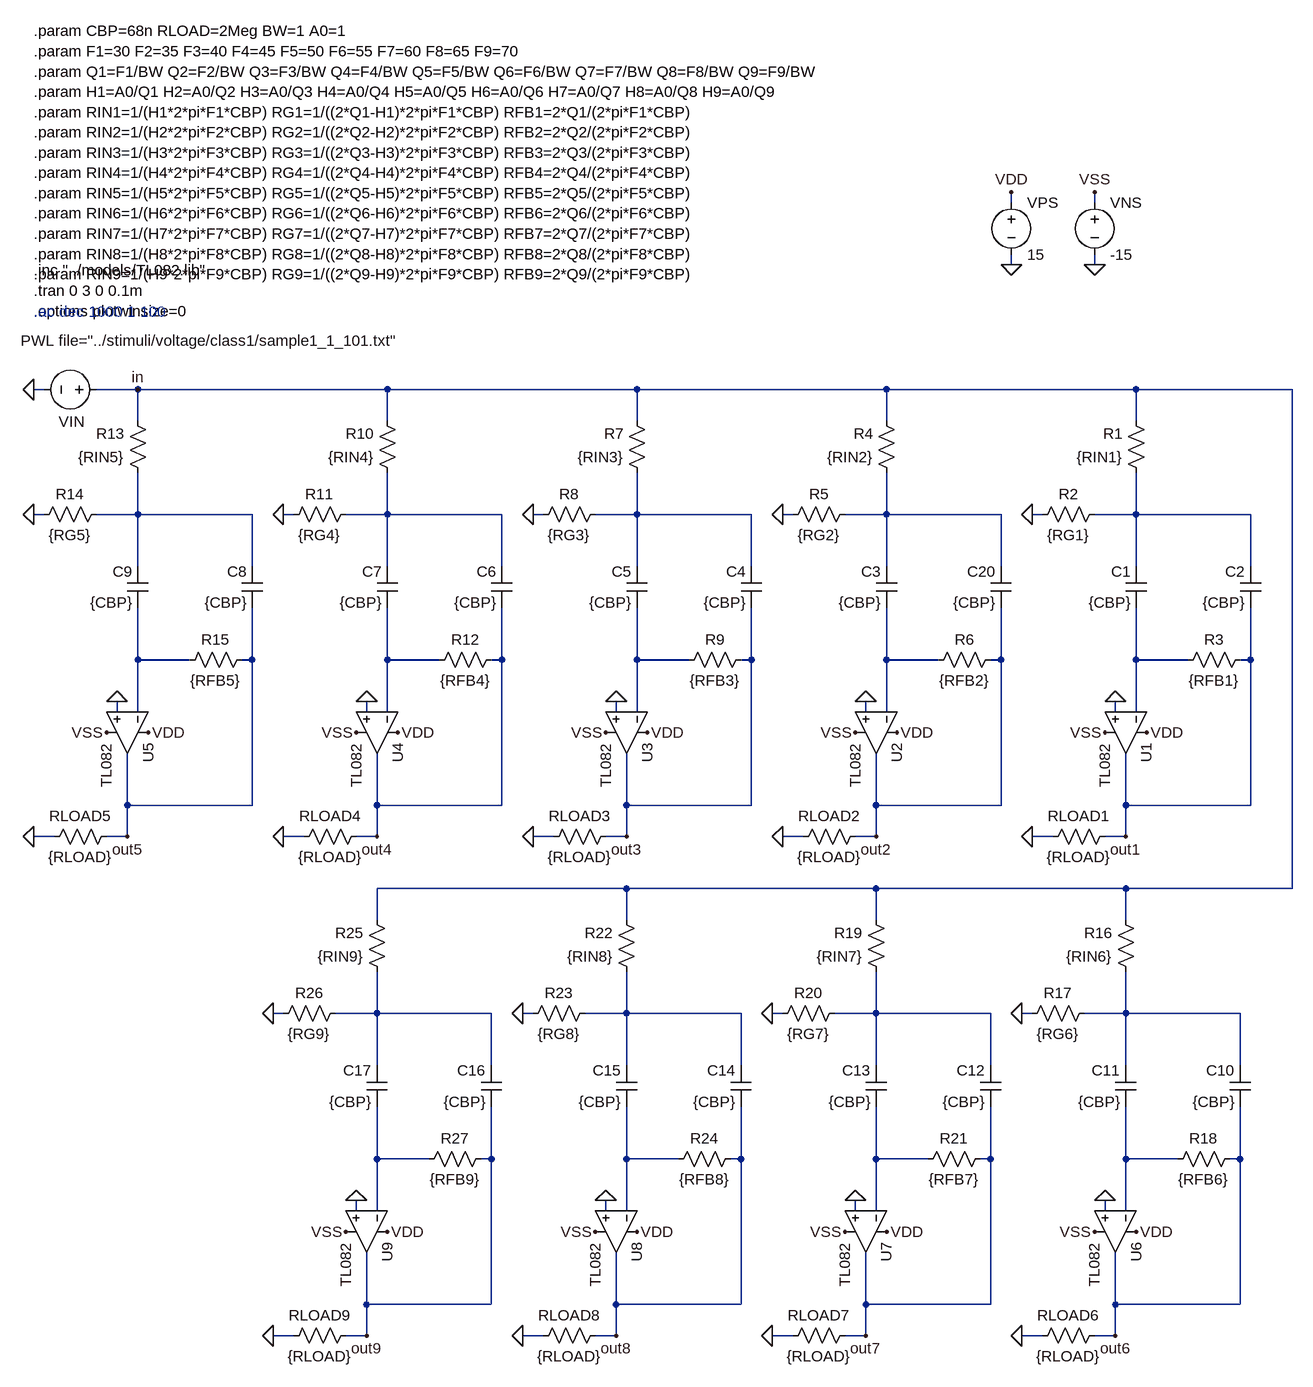
[diagram p0: schematic bpf9.asc]
bpf9.asc, the LTspice schematic file:
Version 4.1
SHEET 1 3572 2112
WIRE 880 -256 880 -272
WIRE 1008 -256 1008 -272
WIRE 880 -160 880 -176
WIRE 1008 -160 1008 -176
WIRE -608 32 -624 32
WIRE -464 32 -528 32
WIRE -80 32 -464 32
WIRE 304 32 -80 32
WIRE 688 32 304 32
WIRE 1072 32 688 32
WIRE 1312 32 1072 32
WIRE -464 80 -464 32
WIRE -80 80 -80 32
WIRE 304 80 304 32
WIRE 688 80 688 32
WIRE 1072 80 1072 32
WIRE -608 224 -624 224
WIRE -464 224 -464 160
WIRE -464 224 -528 224
WIRE -288 224 -464 224
WIRE -224 224 -240 224
WIRE -80 224 -80 160
WIRE -80 224 -144 224
WIRE 96 224 -80 224
WIRE 160 224 144 224
WIRE 304 224 304 160
WIRE 304 224 240 224
WIRE 480 224 304 224
WIRE 544 224 528 224
WIRE 688 224 688 160
WIRE 688 224 624 224
WIRE 864 224 688 224
WIRE 928 224 912 224
WIRE 1072 224 1072 160
WIRE 1072 224 1008 224
WIRE 1248 224 1072 224
WIRE -464 304 -464 224
WIRE -288 304 -288 224
WIRE -80 304 -80 224
WIRE 96 304 96 224
WIRE 304 304 304 224
WIRE 480 304 480 224
WIRE 688 304 688 224
WIRE 864 304 864 224
WIRE 1072 304 1072 224
WIRE 1248 304 1248 224
WIRE -464 448 -464 368
WIRE -384 448 -464 448
WIRE -288 448 -288 368
WIRE -288 448 -304 448
WIRE -80 448 -80 368
WIRE 0 448 -80 448
WIRE 96 448 96 368
WIRE 96 448 80 448
WIRE 304 448 304 368
WIRE 384 448 304 448
WIRE 480 448 480 368
WIRE 480 448 464 448
WIRE 688 448 688 368
WIRE 768 448 688 448
WIRE 864 448 864 368
WIRE 864 448 848 448
WIRE 1072 448 1072 368
WIRE 1152 448 1072 448
WIRE 1248 448 1248 368
WIRE 1248 448 1232 448
WIRE -496 528 -496 512
WIRE -464 528 -464 448
WIRE -112 528 -112 512
WIRE -80 528 -80 448
WIRE 272 528 272 512
WIRE 304 528 304 448
WIRE 656 528 656 512
WIRE 688 528 688 448
WIRE 1040 528 1040 512
WIRE 1072 528 1072 448
WIRE -480 672 -480 592
WIRE -288 672 -288 448
WIRE -288 672 -480 672
WIRE -96 672 -96 592
WIRE 96 672 96 448
WIRE 96 672 -96 672
WIRE 288 672 288 592
WIRE 480 672 480 448
WIRE 480 672 288 672
WIRE 672 672 672 592
WIRE 864 672 864 448
WIRE 864 672 672 672
WIRE 1056 672 1056 592
WIRE 1248 672 1248 448
WIRE 1248 672 1056 672
WIRE -592 720 -624 720
WIRE -480 720 -480 672
WIRE -480 720 -512 720
WIRE -208 720 -240 720
WIRE -96 720 -96 672
WIRE -96 720 -128 720
WIRE 176 720 144 720
WIRE 288 720 288 672
WIRE 288 720 256 720
WIRE 560 720 528 720
WIRE 672 720 672 672
WIRE 672 720 640 720
WIRE 944 720 912 720
WIRE 1056 720 1056 672
WIRE 1056 720 1024 720
WIRE 288 800 -96 800
WIRE 672 800 288 800
WIRE 1056 800 672 800
WIRE 1312 800 1312 32
WIRE 1312 800 1056 800
WIRE -96 848 -96 800
WIRE 288 848 288 800
WIRE 672 848 672 800
WIRE 1056 848 1056 800
WIRE -240 992 -256 992
WIRE -96 992 -96 928
WIRE -96 992 -160 992
WIRE 80 992 -96 992
WIRE 144 992 128 992
WIRE 288 992 288 928
WIRE 288 992 224 992
WIRE 464 992 288 992
WIRE 528 992 512 992
WIRE 672 992 672 928
WIRE 672 992 608 992
WIRE 848 992 672 992
WIRE 912 992 896 992
WIRE 1056 992 1056 928
WIRE 1056 992 992 992
WIRE 1232 992 1056 992
WIRE -96 1072 -96 992
WIRE 80 1072 80 992
WIRE 288 1072 288 992
WIRE 464 1072 464 992
WIRE 672 1072 672 992
WIRE 848 1072 848 992
WIRE 1056 1072 1056 992
WIRE 1232 1072 1232 992
WIRE -96 1216 -96 1136
WIRE -16 1216 -96 1216
WIRE 80 1216 80 1136
WIRE 80 1216 64 1216
WIRE 288 1216 288 1136
WIRE 368 1216 288 1216
WIRE 464 1216 464 1136
WIRE 464 1216 448 1216
WIRE 672 1216 672 1136
WIRE 752 1216 672 1216
WIRE 848 1216 848 1136
WIRE 848 1216 832 1216
WIRE 1056 1216 1056 1136
WIRE 1136 1216 1056 1216
WIRE 1232 1216 1232 1136
WIRE 1232 1216 1216 1216
WIRE -128 1296 -128 1280
WIRE -96 1296 -96 1216
WIRE 256 1296 256 1280
WIRE 288 1296 288 1216
WIRE 640 1296 640 1280
WIRE 672 1296 672 1216
WIRE 1024 1296 1024 1280
WIRE 1056 1296 1056 1216
WIRE -112 1440 -112 1360
WIRE 80 1440 80 1216
WIRE 80 1440 -112 1440
WIRE 272 1440 272 1360
WIRE 464 1440 464 1216
WIRE 464 1440 272 1440
WIRE 656 1440 656 1360
WIRE 848 1440 848 1216
WIRE 848 1440 656 1440
WIRE 1040 1440 1040 1360
WIRE 1232 1440 1232 1216
WIRE 1232 1440 1040 1440
WIRE -224 1488 -256 1488
WIRE -112 1488 -112 1440
WIRE -112 1488 -144 1488
WIRE 160 1488 128 1488
WIRE 272 1488 272 1440
WIRE 272 1488 240 1488
WIRE 544 1488 512 1488
WIRE 656 1488 656 1440
WIRE 656 1488 624 1488
WIRE 928 1488 896 1488
WIRE 1040 1488 1040 1440
WIRE 1040 1488 1008 1488
FLAG -624 32 0
FLAG 912 224 0
FLAG 1040 512 0
FLAG 912 720 0
FLAG 1088 560 VDD
FLAG 1024 560 VSS
FLAG -464 32 in
FLAG 1056 720 out1
FLAG 880 -160 0
FLAG 1008 -160 0
FLAG 880 -272 VDD
FLAG 1008 -272 VSS
FLAG 528 224 0
FLAG 656 512 0
FLAG 528 720 0
FLAG 704 560 VDD
FLAG 640 560 VSS
FLAG 672 720 out2
FLAG 144 224 0
FLAG 272 512 0
FLAG 144 720 0
FLAG 320 560 VDD
FLAG 256 560 VSS
FLAG 288 720 out3
FLAG -240 224 0
FLAG -112 512 0
FLAG -240 720 0
FLAG -64 560 VDD
FLAG -128 560 VSS
FLAG -96 720 out4
FLAG -624 224 0
FLAG -496 512 0
FLAG -624 720 0
FLAG -448 560 VDD
FLAG -512 560 VSS
FLAG -480 720 out5
FLAG 896 992 0
FLAG 1024 1280 0
FLAG 896 1488 0
FLAG 1072 1328 VDD
FLAG 1008 1328 VSS
FLAG 1040 1488 out6
FLAG 512 992 0
FLAG 640 1280 0
FLAG 512 1488 0
FLAG 688 1328 VDD
FLAG 624 1328 VSS
FLAG 656 1488 out7
FLAG 128 992 0
FLAG 256 1280 0
FLAG 128 1488 0
FLAG 304 1328 VDD
FLAG 240 1328 VSS
FLAG 272 1488 out8
FLAG -256 992 0
FLAG -128 1280 0
FLAG -256 1488 0
FLAG -80 1328 VDD
FLAG -144 1328 VSS
FLAG -112 1488 out9
SYMBOL voltage -512 32 R90
WINDOW 123 -47 132 VLeft 2
WINDOW 39 0 0 Left 0
WINDOW 3 -75 132 VLeft 2
WINDOW 0 49 34 VRight 2
SYMATTR Value PWL file="../stimuli/voltage/class1/sample1_1_101.txt"
SYMATTR InstName VIN
SYMBOL res 1088 176 R180
WINDOW 0 36 76 Left 2
WINDOW 3 36 40 Left 2
SYMATTR InstName R1
SYMATTR Value {RIN1}
SYMBOL res 1024 208 R90
WINDOW 0 0 56 VBottom 2
WINDOW 3 32 56 VTop 2
SYMATTR InstName R2
SYMATTR Value {RG1}
SYMBOL cap 1264 368 R180
WINDOW 0 24 56 Left 2
WINDOW 3 24 8 Left 2
SYMATTR InstName C2
SYMATTR Value {CBP}
SYMBOL cap 1088 368 R180
WINDOW 0 24 56 Left 2
WINDOW 3 24 8 Left 2
SYMATTR InstName C1
SYMATTR Value {CBP}
SYMBOL res 1248 432 R90
WINDOW 0 0 56 VBottom 2
WINDOW 3 32 56 VTop 2
SYMATTR InstName R3
SYMATTR Value {RFB1}
SYMBOL res 1040 704 R90
WINDOW 0 0 56 VBottom 2
WINDOW 3 32 56 VTop 2
SYMATTR InstName RLOAD1
SYMATTR Value {RLOAD}
SYMBOL OpAmps\\opamp2 1120 560 R90
SYMATTR InstName U1
SYMATTR Value TL082
SYMBOL voltage 880 -272 R0
WINDOW 123 0 0 Left 0
WINDOW 39 0 0 Left 0
SYMATTR InstName VPS
SYMATTR Value 15
SYMBOL voltage 1008 -272 R0
WINDOW 123 0 0 Left 0
WINDOW 39 0 0 Left 0
SYMATTR InstName VNS
SYMATTR Value -15
SYMBOL res 704 176 R180
WINDOW 0 36 76 Left 2
WINDOW 3 36 40 Left 2
SYMATTR InstName R4
SYMATTR Value {RIN2}
SYMBOL res 640 208 R90
WINDOW 0 0 56 VBottom 2
WINDOW 3 32 56 VTop 2
SYMATTR InstName R5
SYMATTR Value {RG2}
SYMBOL cap 880 368 R180
WINDOW 0 24 56 Left 2
WINDOW 3 24 8 Left 2
SYMATTR InstName C20
SYMATTR Value {CBP}
SYMBOL cap 704 368 R180
WINDOW 0 24 56 Left 2
WINDOW 3 24 8 Left 2
SYMATTR InstName C3
SYMATTR Value {CBP}
SYMBOL res 864 432 R90
WINDOW 0 0 56 VBottom 2
WINDOW 3 32 56 VTop 2
SYMATTR InstName R6
SYMATTR Value {RFB2}
SYMBOL res 656 704 R90
WINDOW 0 0 56 VBottom 2
WINDOW 3 32 56 VTop 2
SYMATTR InstName RLOAD2
SYMATTR Value {RLOAD}
SYMBOL OpAmps\\opamp2 736 560 R90
SYMATTR InstName U2
SYMATTR Value TL082
SYMBOL res 320 176 R180
WINDOW 0 36 76 Left 2
WINDOW 3 36 40 Left 2
SYMATTR InstName R7
SYMATTR Value {RIN3}
SYMBOL res 256 208 R90
WINDOW 0 0 56 VBottom 2
WINDOW 3 32 56 VTop 2
SYMATTR InstName R8
SYMATTR Value {RG3}
SYMBOL cap 496 368 R180
WINDOW 0 24 56 Left 2
WINDOW 3 24 8 Left 2
SYMATTR InstName C4
SYMATTR Value {CBP}
SYMBOL cap 320 368 R180
WINDOW 0 24 56 Left 2
WINDOW 3 24 8 Left 2
SYMATTR InstName C5
SYMATTR Value {CBP}
SYMBOL res 480 432 R90
WINDOW 0 0 56 VBottom 2
WINDOW 3 32 56 VTop 2
SYMATTR InstName R9
SYMATTR Value {RFB3}
SYMBOL res 272 704 R90
WINDOW 0 0 56 VBottom 2
WINDOW 3 32 56 VTop 2
SYMATTR InstName RLOAD3
SYMATTR Value {RLOAD}
SYMBOL OpAmps\\opamp2 352 560 R90
SYMATTR InstName U3
SYMATTR Value TL082
SYMBOL res -64 176 R180
WINDOW 0 36 76 Left 2
WINDOW 3 36 40 Left 2
SYMATTR InstName R10
SYMATTR Value {RIN4}
SYMBOL res -128 208 R90
WINDOW 0 0 56 VBottom 2
WINDOW 3 32 56 VTop 2
SYMATTR InstName R11
SYMATTR Value {RG4}
SYMBOL cap 112 368 R180
WINDOW 0 24 56 Left 2
WINDOW 3 24 8 Left 2
SYMATTR InstName C6
SYMATTR Value {CBP}
SYMBOL cap -64 368 R180
WINDOW 0 24 56 Left 2
WINDOW 3 24 8 Left 2
SYMATTR InstName C7
SYMATTR Value {CBP}
SYMBOL res 96 432 R90
WINDOW 0 0 56 VBottom 2
WINDOW 3 32 56 VTop 2
SYMATTR InstName R12
SYMATTR Value {RFB4}
SYMBOL res -112 704 R90
WINDOW 0 0 56 VBottom 2
WINDOW 3 32 56 VTop 2
SYMATTR InstName RLOAD4
SYMATTR Value {RLOAD}
SYMBOL OpAmps\\opamp2 -32 560 R90
SYMATTR InstName U4
SYMATTR Value TL082
SYMBOL res -448 176 R180
WINDOW 0 36 76 Left 2
WINDOW 3 36 40 Left 2
SYMATTR InstName R13
SYMATTR Value {RIN5}
SYMBOL res -512 208 R90
WINDOW 0 0 56 VBottom 2
WINDOW 3 32 56 VTop 2
SYMATTR InstName R14
SYMATTR Value {RG5}
SYMBOL cap -272 368 R180
WINDOW 0 24 56 Left 2
WINDOW 3 24 8 Left 2
SYMATTR InstName C8
SYMATTR Value {CBP}
SYMBOL cap -448 368 R180
WINDOW 0 24 56 Left 2
WINDOW 3 24 8 Left 2
SYMATTR InstName C9
SYMATTR Value {CBP}
SYMBOL res -288 432 R90
WINDOW 0 0 56 VBottom 2
WINDOW 3 32 56 VTop 2
SYMATTR InstName R15
SYMATTR Value {RFB5}
SYMBOL res -496 704 R90
WINDOW 0 0 56 VBottom 2
WINDOW 3 32 56 VTop 2
SYMATTR InstName RLOAD5
SYMATTR Value {RLOAD}
SYMBOL OpAmps\\opamp2 -416 560 R90
SYMATTR InstName U5
SYMATTR Value TL082
SYMBOL res 1072 944 R180
WINDOW 0 36 76 Left 2
WINDOW 3 36 40 Left 2
SYMATTR InstName R16
SYMATTR Value {RIN6}
SYMBOL res 1008 976 R90
WINDOW 0 0 56 VBottom 2
WINDOW 3 32 56 VTop 2
SYMATTR InstName R17
SYMATTR Value {RG6}
SYMBOL cap 1248 1136 R180
WINDOW 0 24 56 Left 2
WINDOW 3 24 8 Left 2
SYMATTR InstName C10
SYMATTR Value {CBP}
SYMBOL cap 1072 1136 R180
WINDOW 0 24 56 Left 2
WINDOW 3 24 8 Left 2
SYMATTR InstName C11
SYMATTR Value {CBP}
SYMBOL res 1232 1200 R90
WINDOW 0 0 56 VBottom 2
WINDOW 3 32 56 VTop 2
SYMATTR InstName R18
SYMATTR Value {RFB6}
SYMBOL res 1024 1472 R90
WINDOW 0 0 56 VBottom 2
WINDOW 3 32 56 VTop 2
SYMATTR InstName RLOAD6
SYMATTR Value {RLOAD}
SYMBOL OpAmps\\opamp2 1104 1328 R90
SYMATTR InstName U6
SYMATTR Value TL082
SYMBOL res 688 944 R180
WINDOW 0 36 76 Left 2
WINDOW 3 36 40 Left 2
SYMATTR InstName R19
SYMATTR Value {RIN7}
SYMBOL res 624 976 R90
WINDOW 0 0 56 VBottom 2
WINDOW 3 32 56 VTop 2
SYMATTR InstName R20
SYMATTR Value {RG7}
SYMBOL cap 864 1136 R180
WINDOW 0 24 56 Left 2
WINDOW 3 24 8 Left 2
SYMATTR InstName C12
SYMATTR Value {CBP}
SYMBOL cap 688 1136 R180
WINDOW 0 24 56 Left 2
WINDOW 3 24 8 Left 2
SYMATTR InstName C13
SYMATTR Value {CBP}
SYMBOL res 848 1200 R90
WINDOW 0 0 56 VBottom 2
WINDOW 3 32 56 VTop 2
SYMATTR InstName R21
SYMATTR Value {RFB7}
SYMBOL res 640 1472 R90
WINDOW 0 0 56 VBottom 2
WINDOW 3 32 56 VTop 2
SYMATTR InstName RLOAD7
SYMATTR Value {RLOAD}
SYMBOL OpAmps\\opamp2 720 1328 R90
SYMATTR InstName U7
SYMATTR Value TL082
SYMBOL res 304 944 R180
WINDOW 0 36 76 Left 2
WINDOW 3 36 40 Left 2
SYMATTR InstName R22
SYMATTR Value {RIN8}
SYMBOL res 240 976 R90
WINDOW 0 0 56 VBottom 2
WINDOW 3 32 56 VTop 2
SYMATTR InstName R23
SYMATTR Value {RG8}
SYMBOL cap 480 1136 R180
WINDOW 0 24 56 Left 2
WINDOW 3 24 8 Left 2
SYMATTR InstName C14
SYMATTR Value {CBP}
SYMBOL cap 304 1136 R180
WINDOW 0 24 56 Left 2
WINDOW 3 24 8 Left 2
SYMATTR InstName C15
SYMATTR Value {CBP}
SYMBOL res 464 1200 R90
WINDOW 0 0 56 VBottom 2
WINDOW 3 32 56 VTop 2
SYMATTR InstName R24
SYMATTR Value {RFB8}
SYMBOL res 256 1472 R90
WINDOW 0 0 56 VBottom 2
WINDOW 3 32 56 VTop 2
SYMATTR InstName RLOAD8
SYMATTR Value {RLOAD}
SYMBOL OpAmps\\opamp2 336 1328 R90
SYMATTR InstName U8
SYMATTR Value TL082
SYMBOL res -80 944 R180
WINDOW 0 36 76 Left 2
WINDOW 3 36 40 Left 2
SYMATTR InstName R25
SYMATTR Value {RIN9}
SYMBOL res -144 976 R90
WINDOW 0 0 56 VBottom 2
WINDOW 3 32 56 VTop 2
SYMATTR InstName R26
SYMATTR Value {RG9}
SYMBOL cap 96 1136 R180
WINDOW 0 24 56 Left 2
WINDOW 3 24 8 Left 2
SYMATTR InstName C16
SYMATTR Value {CBP}
SYMBOL cap -80 1136 R180
WINDOW 0 24 56 Left 2
WINDOW 3 24 8 Left 2
SYMATTR InstName C17
SYMATTR Value {CBP}
SYMBOL res 80 1200 R90
WINDOW 0 0 56 VBottom 2
WINDOW 3 32 56 VTop 2
SYMATTR InstName R27
SYMATTR Value {RFB9}
SYMBOL res -128 1472 R90
WINDOW 0 0 56 VBottom 2
WINDOW 3 32 56 VTop 2
SYMATTR InstName RLOAD9
SYMATTR Value {RLOAD}
SYMBOL OpAmps\\opamp2 -48 1328 R90
SYMATTR InstName U9
SYMATTR Value TL082
TEXT -624 -520 Left 2 !.param CBP=68n RLOAD=2Meg BW=1 A0=1\n.param F1=30 F2=35 F3=40 F4=45 F5=50 F6=55 F7=60 F8=65 F9=70\n.param Q1=F1/BW Q2=F2/BW Q3=F3/BW Q4=F4/BW Q5=F5/BW Q6=F6/BW Q7=F7/BW Q8=F8/BW Q9=F9/BW\n.param H1=A0/Q1 H2=A0/Q2 H3=A0/Q3 H4=A0/Q4 H5=A0/Q5 H6=A0/Q6 H7=A0/Q7 H8=A0/Q8 H9=A0/Q9\n.param RIN1=1/(H1*2*pi*F1*CBP) RG1=1/((2*Q1-H1)*2*pi*F1*CBP) RFB1=2*Q1/(2*pi*F1*CBP)\n.param RIN2=1/(H2*2*pi*F2*CBP) RG2=1/((2*Q2-H2)*2*pi*F2*CBP) RFB2=2*Q2/(2*pi*F2*CBP)\n.param RIN3=1/(H3*2*pi*F3*CBP) RG3=1/((2*Q3-H3)*2*pi*F3*CBP) RFB3=2*Q3/(2*pi*F3*CBP)\n.param RIN4=1/(H4*2*pi*F4*CBP) RG4=1/((2*Q4-H4)*2*pi*F4*CBP) RFB4=2*Q4/(2*pi*F4*CBP)\n.param RIN5=1/(H5*2*pi*F5*CBP) RG5=1/((2*Q5-H5)*2*pi*F5*CBP) RFB5=2*Q5/(2*pi*F5*CBP)\n.param RIN6=1/(H6*2*pi*F6*CBP) RG6=1/((2*Q6-H6)*2*pi*F6*CBP) RFB6=2*Q6/(2*pi*F6*CBP)\n.param RIN7=1/(H7*2*pi*F7*CBP) RG7=1/((2*Q7-H7)*2*pi*F7*CBP) RFB7=2*Q7/(2*pi*F7*CBP)\n.param RIN8=1/(H8*2*pi*F8*CBP) RG8=1/((2*Q8-H8)*2*pi*F8*CBP) RFB8=2*Q8/(2*pi*F8*CBP)\n.param RIN9=1/(H9*2*pi*F9*CBP) RG9=1/((2*Q9-H9)*2*pi*F9*CBP) RFB9=2*Q9/(2*pi*F9*CBP)
TEXT -624 -152 Left 2 !.inc "../models/TL082.lib"
TEXT -624 -120 Left 2 !.tran 0 3 0 0.1m\n.options plotwinsize=0
TEXT -624 -88 Left 2 ;.ac dec 1000 1 100

The netlist it stands for:
* bpf9.asc
VIN in 0 PWL file="../stimuli/voltage/class1/sample1_1_101.txt"
R1 N005 in {RIN1}
R2 N005 0 {RG1}
C2 out1 N005 {CBP}
C1 N010 N005 {CBP}
R3 out1 N010 {RFB1}
RLOAD1 out1 0 {RLOAD}
X§U1 0 N010 VDD VSS out1 TL082  ; pins In+ In- V+ V- OUT
VPS VDD 0 15
VNS VSS 0 -15
R4 N004 in {RIN2}
R5 N004 0 {RG2}
C20 out2 N004 {CBP}
C3 N009 N004 {CBP}
R6 out2 N009 {RFB2}
RLOAD2 out2 0 {RLOAD}
X§U2 0 N009 VDD VSS out2 TL082  ; pins In+ In- V+ V- OUT
R7 N003 in {RIN3}
R8 N003 0 {RG3}
C4 out3 N003 {CBP}
C5 N008 N003 {CBP}
R9 out3 N008 {RFB3}
RLOAD3 out3 0 {RLOAD}
X§U3 0 N008 VDD VSS out3 TL082  ; pins In+ In- V+ V- OUT
R10 N002 in {RIN4}
R11 N002 0 {RG4}
C6 out4 N002 {CBP}
C7 N007 N002 {CBP}
R12 out4 N007 {RFB4}
RLOAD4 out4 0 {RLOAD}
X§U4 0 N007 VDD VSS out4 TL082  ; pins In+ In- V+ V- OUT
R13 N001 in {RIN5}
R14 N001 0 {RG5}
C8 out5 N001 {CBP}
C9 N006 N001 {CBP}
R15 out5 N006 {RFB5}
RLOAD5 out5 0 {RLOAD}
X§U5 0 N006 VDD VSS out5 TL082  ; pins In+ In- V+ V- OUT
R16 N014 in {RIN6}
R17 N014 0 {RG6}
C10 out6 N014 {CBP}
C11 N018 N014 {CBP}
R18 out6 N018 {RFB6}
RLOAD6 out6 0 {RLOAD}
X§U6 0 N018 VDD VSS out6 TL082  ; pins In+ In- V+ V- OUT
R19 N013 in {RIN7}
R20 N013 0 {RG7}
C12 out7 N013 {CBP}
C13 N017 N013 {CBP}
R21 out7 N017 {RFB7}
RLOAD7 out7 0 {RLOAD}
X§U7 0 N017 VDD VSS out7 TL082  ; pins In+ In- V+ V- OUT
R22 N012 in {RIN8}
R23 N012 0 {RG8}
C14 out8 N012 {CBP}
C15 N016 N012 {CBP}
R24 out8 N016 {RFB8}
RLOAD8 out8 0 {RLOAD}
X§U8 0 N016 VDD VSS out8 TL082  ; pins In+ In- V+ V- OUT
R25 N011 in {RIN9}
R26 N011 0 {RG9}
C16 out9 N011 {CBP}
C17 N015 N011 {CBP}
R27 out9 N015 {RFB9}
RLOAD9 out9 0 {RLOAD}
X§U9 0 N015 VDD VSS out9 TL082  ; pins In+ In- V+ V- OUT
.param CBP=68n RLOAD=2Meg BW=1 A0=1
.param F1=30 F2=35 F3=40 F4=45 F5=50 F6=55 F7=60 F8=65 F9=70
.param Q1=F1/BW Q2=F2/BW Q3=F3/BW Q4=F4/BW Q5=F5/BW Q6=F6/BW Q7=F7/BW Q8=F8/BW Q9=F9/BW
.param H1=A0/Q1 H2=A0/Q2 H3=A0/Q3 H4=A0/Q4 H5=A0/Q5 H6=A0/Q6 H7=A0/Q7 H8=A0/Q8 H9=A0/Q9
.param RIN1=1/(H1*2*pi*F1*CBP) RG1=1/((2*Q1-H1)*2*pi*F1*CBP) RFB1=2*Q1/(2*pi*F1*CBP)
.param RIN2=1/(H2*2*pi*F2*CBP) RG2=1/((2*Q2-H2)*2*pi*F2*CBP) RFB2=2*Q2/(2*pi*F2*CBP)
.param RIN3=1/(H3*2*pi*F3*CBP) RG3=1/((2*Q3-H3)*2*pi*F3*CBP) RFB3=2*Q3/(2*pi*F3*CBP)
.param RIN4=1/(H4*2*pi*F4*CBP) RG4=1/((2*Q4-H4)*2*pi*F4*CBP) RFB4=2*Q4/(2*pi*F4*CBP)
.param RIN5=1/(H5*2*pi*F5*CBP) RG5=1/((2*Q5-H5)*2*pi*F5*CBP) RFB5=2*Q5/(2*pi*F5*CBP)
.param RIN6=1/(H6*2*pi*F6*CBP) RG6=1/((2*Q6-H6)*2*pi*F6*CBP) RFB6=2*Q6/(2*pi*F6*CBP)
.param RIN7=1/(H7*2*pi*F7*CBP) RG7=1/((2*Q7-H7)*2*pi*F7*CBP) RFB7=2*Q7/(2*pi*F7*CBP)
.param RIN8=1/(H8*2*pi*F8*CBP) RG8=1/((2*Q8-H8)*2*pi*F8*CBP) RFB8=2*Q8/(2*pi*F8*CBP)
.param RIN9=1/(H9*2*pi*F9*CBP) RG9=1/((2*Q9-H9)*2*pi*F9*CBP) RFB9=2*Q9/(2*pi*F9*CBP)
.inc "../models/TL082.lib"
.tran 0 3 0 0.1m
.options plotwinsize=0
* .ac dec 1000 1 100
.backanno
.end